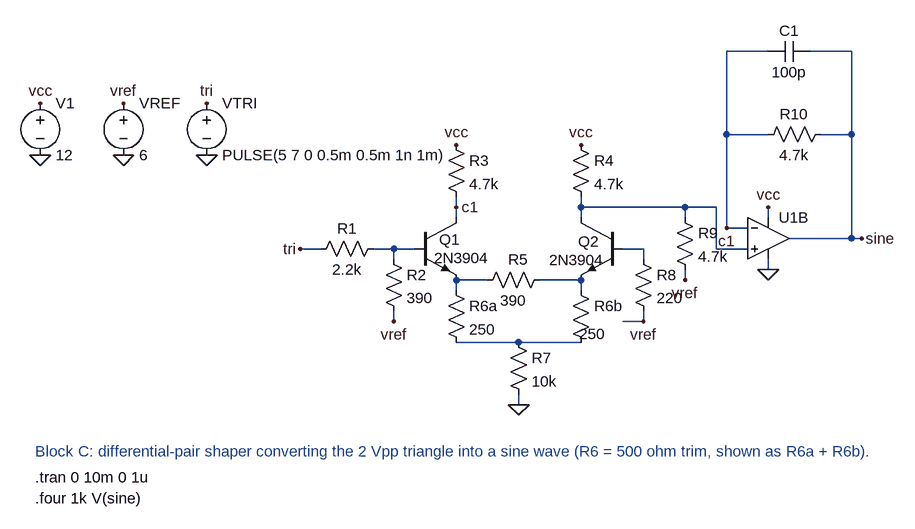
[diagram p0: schematic blockC.asc]
blockC.asc, the LTspice schematic file:
Version 4.1
SHEET 1 1400 640
WIRE 800 -64 736 -64
WIRE 928 -64 864 -64
WIRE 736 64 736 -64
WIRE 800 64 736 64
WIRE 928 64 928 -64
WIRE 928 64 880 64
WIRE 320 176 320 160
WIRE 512 176 512 160
WIRE 672 176 512 176
WIRE 720 176 672 176
WIRE 320 192 320 176
WIRE 512 192 512 176
WIRE 672 192 672 176
WIRE 800 192 800 176
WIRE 736 208 736 64
WIRE 768 208 736 208
WIRE 928 224 928 64
WIRE 928 224 832 224
WIRE 944 224 928 224
WIRE 112 240 80 240
WIRE 224 240 192 240
WIRE 256 240 224 240
WIRE 608 240 576 240
WIRE 720 240 720 176
WIRE 768 240 720 240
WIRE 224 256 224 240
WIRE 608 256 608 240
WIRE 800 272 800 256
WIRE 368 288 320 288
WIRE 512 288 448 288
WIRE 672 288 672 272
WIRE 320 304 320 288
WIRE 512 304 512 288
WIRE 224 352 224 336
WIRE 608 352 608 336
WIRE 608 352 576 352
WIRE 416 384 320 384
WIRE 512 384 416 384
WIRE 416 480 416 464
FLAG -320 16 vcc
FLAG -320 96 0
FLAG -192 16 vref
FLAG -192 96 0
FLAG -64 16 tri
FLAG -64 96 0
FLAG 80 240 tri
FLAG 224 352 vref
FLAG 320 80 vcc
FLAG 512 80 vcc
FLAG 320 176 c1
FLAG 672 288 vref
FLAG 608 352 vref
FLAG 416 480 0
FLAG 736 208 c1
FLAG 800 176 vcc
FLAG 800 272 0
FLAG 944 224 sine
SYMBOL voltage -320 0 R0
WINDOW 123 0 0 Left 0
WINDOW 39 0 0 Left 0
SYMATTR InstName V1
SYMATTR Value 12
SYMBOL voltage -192 0 R0
WINDOW 123 0 0 Left 0
WINDOW 39 0 0 Left 0
SYMATTR InstName VREF
SYMATTR Value 6
SYMBOL voltage -64 0 R0
WINDOW 123 0 0 Left 0
WINDOW 39 0 0 Left 0
SYMATTR InstName VTRI
SYMATTR Value PULSE(5 7 0 0.5m 0.5m 1n 1m)
SYMBOL res 208 224 R90
WINDOW 0 0 56 VBottom 2
WINDOW 3 32 56 VTop 2
SYMATTR InstName R1
SYMATTR Value 2.2k
SYMBOL res 208 240 R0
SYMATTR InstName R2
SYMATTR Value 390
SYMBOL res 304 64 R0
SYMATTR InstName R3
SYMATTR Value 4.7k
SYMBOL res 496 64 R0
SYMATTR InstName R4
SYMATTR Value 4.7k
SYMBOL npn 256 192 R0
WINDOW 0 38 34 Left 2
WINDOW 3 30 62 Left 2
SYMATTR InstName Q1
SYMATTR Value 2N3904
SYMBOL npn 576 192 M0
WINDOW 0 36 37 Left 2
WINDOW 3 28 65 Left 2
SYMATTR InstName Q2
SYMATTR Value 2N3904
SYMBOL res 464 272 R90
WINDOW 0 0 49 VBottom 2
WINDOW 3 32 56 VTop 2
SYMATTR InstName R5
SYMATTR Value 390
SYMBOL res 304 288 R0
SYMATTR InstName R6a
SYMATTR Value 250
SYMBOL res 496 288 R0
WINDOW 3 13 83 Left 2
SYMATTR InstName R6b
SYMATTR Value 250
SYMBOL res 400 368 R0
SYMATTR InstName R7
SYMATTR Value 10k
SYMBOL res 592 240 R0
SYMATTR InstName R8
SYMATTR Value 220
SYMBOL res 656 176 R0
SYMATTR InstName R9
SYMATTR Value 4.7k
SYMBOL res 896 48 R90
WINDOW 0 0 56 VBottom 2
WINDOW 3 32 56 VTop 2
SYMATTR InstName R10
SYMATTR Value 4.7k
SYMBOL cap 864 -80 R90
WINDOW 0 0 32 VBottom 2
WINDOW 3 32 32 VTop 2
SYMATTR InstName C1
SYMATTR Value 100p
SYMBOL OpAmps\\UniversalOpAmp2 800 224 R0
SYMATTR InstName U1B
SYMATTR Value2 Avol=200k GBW=3Meg Slew=13Meg
SYMATTR SpiceLine ilimit=25m rail=1.5 Vos=0 phimargin=45 en=0 enk=0 in=0 ink=0 Rin=1T
TEXT -328 552 Left 2 ;Block C: differential-pair shaper converting the 2 Vpp triangle into a sine wave (R6 = 500 ohm trim, shown as R6a + R6b).
TEXT -328 592 Left 2 !.tran 0 10m 0 1u
TEXT -328 624 Left 2 !.four 1k V(sine)

The netlist it stands for:
* blockC.asc
V1 vcc 0 12
VREF vref 0 6
VTRI tri 0 PULSE(5 7 0 0.5m 0.5m 1n 1m)
R1 N002 tri 2.2k
R2 N002 vref 390
R3 vcc c1 4.7k
R4 vcc N001 4.7k
Q1 c1 N002 N004 0 2N3904
Q2 N001 N003 N005 0 2N3904
R5 N005 N004 390
R6a N004 N006 250
R6b N005 N006 250
R7 N006 0 10k
R8 N003 vref 220
R9 N001 vref 4.7k
R10 sine c1 4.7k
C1 sine c1 100p
X§U1B N001 c1 vcc 0 sine level2 Avol=200k GBW=3Meg Slew=13Meg ilimit=25m rail=1.5 Vos=0 phimargin=45 en=0 enk=0 in=0 ink=0 Rin=1T En=0 Enk=0 In=0 Ink=0 Rin=500Meg  ; pins In+ In- V+ V- OUT
.model NPN NPN
.model PNP PNP
.lib standard.bjt
* Block C: differential-pair shaper converting the 2 Vpp triangle into a sine wave (R6 = 500 ohm trim, shown as R6a + R6b).
.tran 0 10m 0 1u
.four 1k V(sine)
.lib UniversalOpAmp2.lib
.backanno
.end